# Altium project PGS-System.PrjPcb (part 5 of 16)

## Sheet BUCK_CONTROLLER_SHEET2.SchDoc
size A4; SheetNumber: 4; SheetTotal: 28
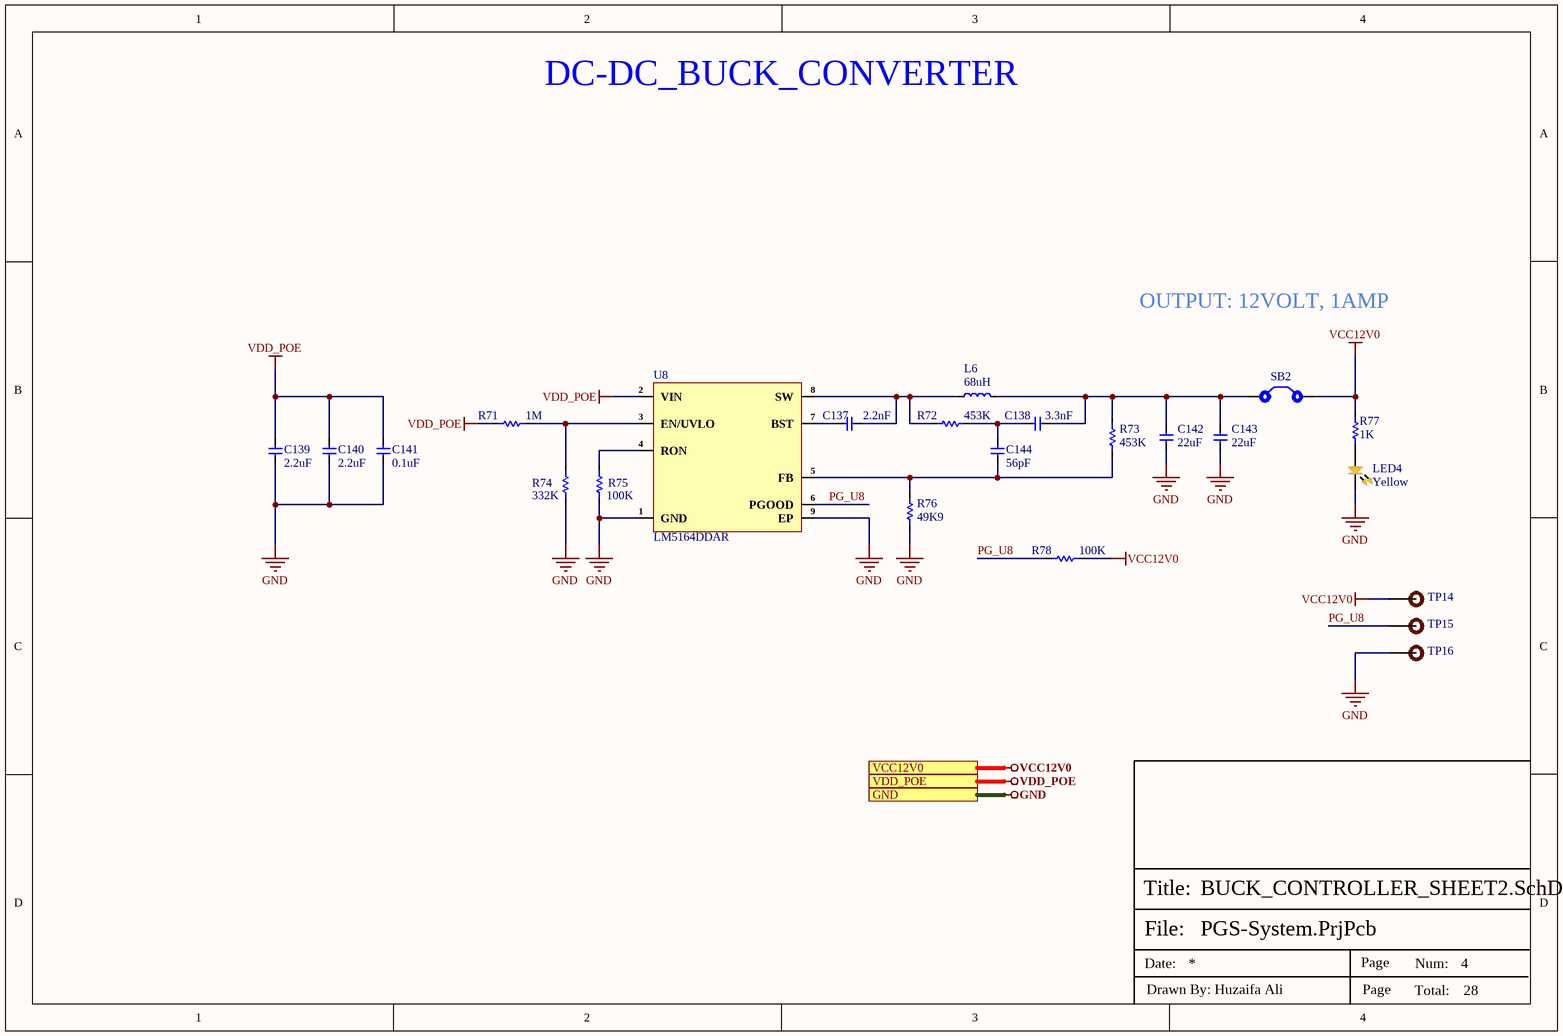
[diagram p3: BUCK_CONTROLLER_SHEET2.SchDoc]

### Parts
C137  2.2nF  [Cap-0603]
C138  3.3nF  [Cap-0603]
C139  2.2uF  [Cap-0805]
C140  2.2uF  [Cap-0805]
C141  0.1uF  [Cap-0603]
C142  22uF  [Cap-0805]
C143  22uF  [Cap-0805]
C144  56pF  [Cap-0402]
L6  68uH  [PSPMAA0605H-680M-IGF]
LED4  Yellow  [LED-0402]
R71  1M  [Res-0603]
R72  453K  [Res-0603]
R73  453K  [Res-0603]
R74  332K  [Res-0603]
R75  100K  [Res-0603]
R76  49K9  [Res-0603]
R77  1K  [Res-0402]
R78  100K  [Res-0603]
SB2  Solder Bridge_1206  [SOLDER BRIDGE-1206_]  (value not drawn)  (no BOM)
TP14  TEST POINT 0.5mm Dia  [Test-point - 0.5mm]  (value not drawn)  (no BOM)
TP15  TEST POINT 0.5mm Dia  [Test-point - 0.5mm]  (value not drawn)  (no BOM)
TP16  TEST POINT 0.5mm Dia  [Test-point - 0.5mm]  (value not drawn)  (no BOM)
U8  LM5164DDAR  [8-SO-EP_]

### Ports
GND (see BUCK_CONVERTER_SHEET1[3D], DDR3_SDRAM_SHEET[5D], DEBUG_UART_INTERFACE[3D], DIGITAL_MEMS_INTERFACE[3C], eMMC_INTERFACE[3D], ETH_PoE-PD_INTERFACE[4D], ETH_SWITCH_INTERFACE[5D], IR-CUT_LIGHT SENSOR_SHEET[3D], MIPI TO HDMI_MODULE[3D], MIPI-CSI_RXX_INTERFACE[3C], PoE_PSE_CONTROLLER[5D], POWER_LDO_SHEET[3D], POWER_PMIC_RK809_CODEC[3C], POWER_PMIC_RK809_DC DC[3D], POWER_PMIC_RK809_LDO[4C], POWER_PMIC_RK809_MGM[3D], RV1126_AUDIO_SHEET[3D], RV1126_DRAM_SHEET[4C], RV1126_eMMC_SPI-FLASH[3C], RV1126_ETHERNET_SHEET[3D], RV1126_OSC-PLL-PMUIO[3C], RV1126_POWER_SHEET[1D], RV1126_SARADC_SHEET[3C], RV1126_SDMMC_SHEET[3C], SPEARKER_INTERFACE_SHEET[3C], SPI_FLASH_INTERFACE[3D], USB2.0_DEBUG_UART[3D]), VCC12V0 (see SPEARKER_INTERFACE_SHEET[3C]), VDD_POE (see BUCK_CONVERTER_SHEET1[3D], ETH_PoE-PD_INTERFACE[4D], PoE_PSE_CONTROLLER[5D])

### Nets
GND: C139.1 C140.1 C141.1 C142.1 C143.1 LED4.2 R74.2 R75.1 R76.1 TP16.1 U8.1(GND) U8.9(EP) ; port GND  [project net KSENSD]
VCC12V0: R77.2 R78.1 SB2.2 TP14.1 ; port VCC12V0
VDD_POE: C139.2 C140.2 C141.2 R71.2 U8.2(VIN) ; port VDD_POE
PG_U8: R78.2 TP15.1 U8.6(PGOOD)
NetC137_1: C137.1 L6.1 R72.1 U8.8(SW)
NetC137_2: C137.2 U8.7(BST)
NetC138_1: C138.1 C144.2 R72.2
NetC138_2: C138.2 C142.2 C143.2 L6.2 R73.2 SB2.1
NetC144_1: C144.1 R73.1 R76.2 U8.5(FB)
NetLED4_1: LED4.1 R77.1
NetR71_1: R71.1 R74.1 U8.3(EN/UVLO)
NetR75_2: R75.2 U8.4(RON)

### Notes on the sheet
- DC-DC_BUCK_CONVERTER
- OUTPUT: 12VOLT, 1AMP
- File:
- Title:
- Date:
- Page
- Num:
- Total:
- Drawn By: Huzaifa Ali

### Library data of the parts
C137 = CC0603KRX7R9BB222: CAP CER 2200PF 50V X7R 0603; Manufacturer: Yageo; Tolerance: 10%; Insulation Resistance: 10GR; Dissipation Factor: 2.5%; Item Type: Capacitor; Supplier 1: RSComponents; Manufacturer Part Number: CC0603KRX7R9BB222; RoHS: Yes; Category: Ceramic Capacitors; Stock 1: 1; Pricing 1: 4000=0.00500 (USD); Mount: Surface Mount; Case/Package: 0603; Number of Pins: 2; Case Code (Metric): 1608; Case Code (Imperial): 0603; Min Operating Temperature: -55°C; Max Operating Temperature: 125°C; Capacitance: 2.2nF; Dielectric: X7R; Package Quantity: 1; Voltage Rating: 50V; Packaging: Tape and Reel; Voltage Rating (DC): 50V; Termination: SMD/SMT; Resistor Type: Ceramic; Voltage: 50V; Series: CC; Length: 1.6mm; Width: 0.031inch; Height: 0.8mm; Thickness: 0.035inch; Depth: 0.8mm; Radiation Hardening: No; REACH SVHC: No SVHC; Lead Free: Lead Free; Halogen Free: Halogen Free; RoHS Compliant: Yes; ComponentLink1URL: https://datasheet.ciiva.com/23768/1079489-23768004.pdf?src-supplier=Newark; ComponentLink1Description: https://datasheet.ciiva.com/23768/1079489-23768004.pdf?src-supplier=Newark; ComponentLink2URL: https://datasheet.ciiva.com/11788/0900766b8079c870-11788403.pdf?src-supplier=RSComponents; ComponentLink2Description: https://datasheet.ciiva.com/11788/0900766b8079c870-11788403.pdf?src-supplier=RSComponents; ComponentLink3URL: https://datasheet.ciiva.com/26862/getdatasheetpartid-403587-26862854.pdf?src-supplier=Verical; ComponentLink3Description: https://datasheet.ciiva.com/26862/getdatasheetpartid-403587-26862854.pdf?src-supplier=Verical; ComponentLink4URL: https://datasheet.ciiva.com/8033/70765-8033863.pdf?src-supplier=Element14; ComponentLink4Description: https://datasheet.ciiva.com/8033/70765-8033863.pdf?src-supplier=Element14; ComponentLink5URL: https://datasheet.ciiva.com/7978/1489800-7978172.pdf?src-supplier=Element14; ComponentLink5Description: https://datasheet.ciiva.com/7978/1489800-7978172.pdf?src-supplier=Element14; ComponentLink6URL: https://datasheet.ciiva.com/28450/1489800-28450632.pdf?src-supplier=Element14; ComponentLink6Description: https://datasheet.ciiva.com/28450/1489800-28450632.pdf?src-supplier=Element14; ComponentLink7URL: https://datasheet.ciiva.com/155/mlccorderingcode-155921.pdf?src-supplier=Digi-Key; ComponentLink7Description: https://datasheet.ciiva.com/155/mlccorderingcode-155921.pdf?src-supplier=Digi-Key; ComponentLink8URL: https://datasheet.ciiva.com/155/mlccorderingcode-155920.pdf?src-supplier=Digi-Key; ComponentLink8Description: https://datasheet.ciiva.com/155/mlccorderingcode-155920.pdf?src-supplier=Digi-Key; ComponentLink9URL: https://datasheet.ciiva.com/155/mlccorderingcode-155922.pdf?src-supplier=Digi-Key; ComponentLink9Description: https://datasheet.ciiva.com/155/mlccorderingcode-155922.pdf?src-supplier=Digi-Key; ComponentLink10URL: https://datasheet.ciiva.com/8033/1489800-8033864.pdf?src-supplier=Element14; ComponentLink10Description: https://datasheet.ciiva.com/8033/1489800-8033864.pdf?src-supplier=Element14; ComponentLink11URL: https://datasheet.ciiva.com/8033/1489800-8033862.pdf?src-supplier=Element14; ComponentLink11Description: https://datasheet.ciiva.com/8033/1489800-8033862.pdf?src-supplier=Element14; ComponentLink12URL: https://datasheet.ciiva.com/16625/upy-gphc-x7r-6-3v-to-50v-8-16625531.pdf?src-supplier=Avnet+Europe; ComponentLink12Description: https://datasheet.ciiva.com/16625/upy-gphc-x7r-6-3v-to-50v-8-16625531.pdf?src-supplier=Avnet+Europe; Supplier Part Number 1: 6169509; LCSC Part Number: C107082
C138 = 0603B332K500CT: MLCC 3.3nF 50V X7R 0603; Manufacturer: Walsin Technologies; Tolerance: 10%; Item Type: Capacitor; Supplier 1: Arrow Electronics; Manufacturer Part Number: 0603B332K500CT; RoHS: Yes; Category: Ceramic Capacitors; Stock 1: 88000; Pricing 1: 4000=0.00570, 12000=0.00560 (USD); Case/Package: Ceramic; Case Code (Metric): 1608; Case Code (Imperial): 0603; Min Operating Temperature: -55°C; Max Operating Temperature: 125°C; Packaging: Tape and Reel; Capacitance: 3.3nF; Dielectric: X7R; Voltage Rating: 50V; Voltage Rating (DC): 50V; Length: 1.6mm; Depth: 0.8mm; Radiation Hardening: No; RoHS Compliant: Yes; REACH SVHC: Unknown; Lead Free: Lead Free; ComponentLink1URL: https://datasheet.ciiva.com/26864/getdatasheetpartid-414329-26864536.pdf?src-supplier=Verical; ComponentLink1Description: https://datasheet.ciiva.com/26864/getdatasheetpartid-414329-26864536.pdf?src-supplier=Verical; Supplier Part Number 1: 0603B332K500CT; LCSC Part Number: C302028
C139 C140 = GRM21BD72A225KE01L: as C249 on sheet BUCK_CONVERTER_SHEET1; Supplier 1: Digi-Key; Manufacturer Part Number: GRM21BD72A225KE01L; RoHS: No; Category: Ceramic Capacitors; Stock 1: 2439; Pricing 1: 1=0.55000, 10=0.38600, 50=0.29220, 100=0.25440, 500=0.18846, 1000=0.16020 (USD); RoHS Compliant: Yes; LCSC Part Number: C2981733; ComponentLink1Description: LCSC; ComponentLink1URL: https://www.lcsc.com/product-detail/Multilayer-Ceramic-Capacitors-MLCC-SMD-SMT_Murata-Electronics-GRM21BD72A225KE01L_C2981733.html; Supplier Part Number 1: 490-GRM21BD72A225KE01LCT-ND
C141 = CC0603KRX7R0BB104: as C119 on sheet ETH_PoE-PD_INTERFACE; Supplier 1: Digi-Key; Manufacturer Part Number: CC0603KRX7R0BB104; RoHS: Yes; Category: Ceramic Capacitors; Stock 1: 60476; Pricing 1: 1=0.19000, 10=0.13500, 50=0.07680, 100=0.06370, 500=0.04466, 1000=0.03696 (USD); Mount: Surface Mount; Case/Package: 0603; Case Code (Metric): 1608; Case Code (Imperial): 0603; Weight: 7.1E-05oz; Min Operating Temperature: -55°C; Max Operating Temperature: 125°C; Package Quantity: 4000; Voltage Rating: 100V; Packaging: Tape and Reel; Dielectric: X7R; Termination: SMD/SMT; Resistor Type: Ceramic; Voltage Rating (DC): 100V; Series: CC; Length: 0.063inch; Width: 0.031inch; Thickness: 0.035inch; Depth: 0.8mm; Lead Free: Lead Free; RoHS Compliant: Yes; ComponentLink1URL: https://datasheet.ciiva.com/6277/mlccorderingcode-6277030.pdf?src-supplier=Digi-Key; ComponentLink1Description: https://datasheet.ciiva.com/6277/mlccorderingcode-6277030.pdf?src-supplier=Digi-Key; ComponentLink2URL: https://datasheet.ciiva.com/6277/mlccorderingcode-6277081.pdf?src-supplier=Digi-Key; ComponentLink2Description: https://datasheet.ciiva.com/6277/mlccorderingcode-6277081.pdf?src-supplier=Digi-Key; ComponentLink3URL: https://datasheet.ciiva.com/6277/mlccorderingcode-6277082.pdf?src-supplier=Digi-Key; ComponentLink3Description: https://datasheet.ciiva.com/6277/mlccorderingcode-6277082.pdf?src-supplier=Digi-Key; Supplier Part Number 1: 311-1523-1-ND; LCSC Part Number: C113803
C142 C143 = C2012X5R1V226MT000E: CAP CER 22UF 35V X5R 0805; Manufacturer: TDK Corporation; Item Type: Capacitor; Manufacturer Part Number: C2012X5R1V226MT000E; Package: 0805; ComponentLink1Description: LCSC; ComponentLink1URL: https://www.lcsc.com/product-detail/Multilayer-Ceramic-Capacitors-MLCC-SMD-SMT_TDK-C2012X5R1V226M125AC_C2179409.html; LCSC Part Number: C338080
C144 = CC0402FRNPO9BN560: CAP CER 56PF 50V C0G/NPO 0402; Manufacturer: Yageo; Item Type: Capacitor; Supplier: Digikey; Supplier Part Number: 311-3734-1-ND; Manufacturer Part Number: CC0402FRNPO9BN560; RoHS: Yes; Category: Ceramic Capacitors; Stock: 144734; Pricing: 1=0.1, 10=0.067, 50=0.0384, 100=0.0297, 500=0.02238, 1000=0.01758, 2500=0.01598, 5000=0.0147 (USD); ComponentLink1URL: https://datasheet.ciiva.com/11587/upy-gp-np0-16v-to-50v-8-11587063.pdf?src-supplier=Avnet; ComponentLink1Description: https://datasheet.ciiva.com/11587/upy-gp-np0-16v-to-50v-8-11587063.pdf?src-supplier=Avnet; ComponentLink2URL: https://datasheet.ciiva.com/13211/upy-gp-np0-16v-to-50v-8-13211096.pdf?src-supplier=Mouser; ComponentLink2Description: https://datasheet.ciiva.com/13211/upy-gp-np0-16v-to-50v-8-13211096.pdf?src-supplier=Mouser; LCSC Part Number: C526981
L6 = PSPMAA0605H-680M-IGF: 2A 68uH ±20% 2.5A SMD,6.6x7.1mm Power Inductors ROHS; Manufacturer: PROD Tech; Manufacturer Part Number: PSPMAA0605H-680M-IGF; Package: SMD,6.6x7.1mm; LCSC Part Number: C2983094; Item Type: Inductor; ComponentLink1Description: LCSC; ComponentLink1URL: https://www.lcsc.com/product-detail/Power-Inductors_PROD-Tech-PSPMAA0605H-680M-IGF_C2983094.html
LED4 = XZMYK68W-2: LED YELLOW CLEAR CHIP SMD; Manufacturer: SunLED; Lens Color: Colorless; Luminous Intensity: 148mcd; Test Current: 20mA; Viewing Angle: 120°; Dominant Wavelength: 590nm; Forward Voltage: 2V; Supplier 1: Digi-Key; Manufacturer Part Number: XZMYK68W-2; RoHS: Yes; Category: LEDs; Stock 1: 36021; Pricing 1: 1=0.36000, 10=0.28400, 100=0.12770, 500=0.11536, 1000=0.09476 (USD); Mount: Surface Mount; Case/Package: 0402; Color: Yellow; Case Code (Metric): 1005; Case Code (Imperial): 0402; Packaging: Tape and Reel; Lens Transparency: Clear; Length: 1mm; Width: 0.5mm; Height: 0.6mm; RoHS Compliant: Yes; ComponentLink1URL: http://www.sunledusa.com/products/spec/XZMYK68W-2.pdf?src-supplier=Digi-Key; ComponentLink1Description: http://www.sunledusa.com/products/spec/XZMYK68W-2.pdf?src-supplier=Digi-Key; Supplier Part Number 1: 1497-1198-1-ND; Item Type: LED
R71 = RC0603FR-071ML: as R172 on sheet BUCK_CONVERTER_SHEET1; Supplier 1: Digi-Key; Manufacturer Part Number: RC0603FR-071ML; Stock 1: 3824601; Pricing 1: 1=0.1, 10=0.023, 100=0.0094, 1000=0.00421, 2500=0.00366 (USD); Case/Package: 0603; Number of Pins: 2; Case Code (Imperial): 0603; Case Code (Metric): 1608; Min Operating Temperature: -55°C; Max Operating Temperature: 155°C; Voltage Rating (DC): 50V; Tolerance: 1%; Packaging: Tape and Reel; Package Quantity: 5000; Termination: SMD/SMT; Composition: Thick Film; Military Standard: Not; Length: 1.6mm; Height: 0.45mm; Width: 0.8mm; Depth: 0.8mm; REACH SVHC: No SVHC; Lead Free: Lead Free; ComponentLink1URL: http://www.farnell.com/datasheets/2167052.pdf?src-supplier=Mouser; ComponentLink1Description: http://www.farnell.com/datasheets/2167052.pdf?src-supplier=Mouser; ComponentLink2URL: http://www.farnell.com/datasheets/2167052.pdf?src-supplier=Element14; ComponentLink2Description: http://www.farnell.com/datasheets/2167052.pdf?src-supplier=Element14; ComponentLink3URL: http://documents.rs-components.com/techlib://itc_doclist_GB.htm?stockno=5048956&src-supplier=RSComponents; ComponentLink3Description: http://documents.rs-components.com/techlib://itc_doclist_GB.htm?stockno=5048956&src-supplier=RSComponents; Supplier Part Number 1: 311-1.00MHRDKR-ND; LCSC Part Number: C105578
R72 R73 = RC0603FR-07453KL: RES 453K OHM 1% 1/10W 0603; Manufacturer: Yageo; Item Type: Resistor; Supplier: Future Electronics; LCSC Part Number: C273765; Manufacturer Part Number: RC0603FR-07453KL; RoHS: Yes; Stock: 90000; Pricing: 5000=0.0012, 50000=0.0012, 150000=0.0011, 375000=0.0011, 1000000=0.001 (USD); ComponentLink1URL: https://datasheet.ciiva.com/8885/pyu-rc0603-51-rohs-l-4-8885677.pdf?src-supplier=Avnet; ComponentLink1Description: https://datasheet.ciiva.com/8885/pyu-rc0603-51-rohs-l-4-8885677.pdf?src-supplier=Avnet
R74 = RT0603BRD07332KL: RES SMD 332K OHM 0.1% 1/10W 0603; Manufacturer: Yageo; Value: 332kR; Power Rating: 100mW; Voltage Rating: 75V; Temperature Coefficient: 25ppm/°C; Voltage Rating (DC): 50V; Item Type: Resistor; Supplier 1: Rs; Manufacturer Part Number: RT0603BRD07332KL; RoHS: Yes; Category: Chip SMD Resistors; Stock 1: 3940; Pricing 1: 10=0.21700, 100=0.20200, 250=0.18900, 500=0.17600, 1000=0.16000 (GBP); Case/Package: 0603; Case Code (Metric): 1608; Case Code (Imperial): 0603; Weight: 7.1E-05oz; Contact Plating: Tin,Matte; Min Operating Temperature: -55°C; Max Operating Temperature: 125°C; Package Quantity: 5000; Packaging: Tape and Reel; Tolerance: 0.1%; Resistor Type: Thin Film; Number of Terminations: 2; Termination: SMD/SMT; Max Power Dissipation: 100mW; Series: RT; Construction: Rectangular; Length: 1.6mm; Width: 0.031inch; Height: 0.022inch; Depth: 0.8mm; Radiation Hardening: No; Military Standard: Not; Lead Free: Lead Free; RoHS Compliant: Yes; ComponentLink1URL: https://datasheet.ciiva.com/2585/pyu-rt-1-to-0-05-rohs-l-5-2585888.pdf?src-supplier=Digi-Key; ComponentLink1Description: https://datasheet.ciiva.com/2585/pyu-rt-1-to-0-05-rohs-l-5-2585888.pdf?src-supplier=Digi-Key; ComponentLink2URL: https://datasheet.ciiva.com/8886/pyu-rt-1-to-0-05-rohs-l-4-8886136.pdf?src-supplier=Avnet; ComponentLink2Description: https://datasheet.ciiva.com/8886/pyu-rt-1-to-0-05-rohs-l-4-8886136.pdf?src-supplier=Avnet; ComponentLink3URL: https://datasheet.ciiva.com/12811/pyu-rt-1-to-0-05-rohs-l-4-12811625.pdf?src-supplier=Mouser; ComponentLink3Description: https://datasheet.ciiva.com/12811/pyu-rt-1-to-0-05-rohs-l-4-12811625.pdf?src-supplier=Mouser; Supplier Part Number 1: 1991511; LCSC Part Number: C861329
R75 R78 = CRCW0603100KFKEA: RES SMD 100K OHM 1% 1/10W 0603; Item Type: Resistor; Value: 100kR; Temperature Coefficient: 100ppm/°C; Voltage Rating: 75V; Power Rating: 100mW; ComponentLink1Description: LCSC; Supplier: Mouser; Supplier Part Number: 71-CRCW0603-100K-E3; RoHS: Yes; Category: Chip SMD Resistors; Stock: 716604; Pricing: 1=0.1, 10=0.019, 50=0.019, 100=0.009, 1000=0.007, 10000=0.004 (USD); Case/Package: 345Case; Pins: 2NUMBER; Case Code (Imperial): 0603; Case Code (Metric): 1608; Min Operating Temperature: -55°C; Max Operating Temperature: 155°C; Tolerance: 1%; Resistor Type: Thick Film; Resistance Tolerance: 1%; Packaging: 13Packaging; Voltage Rating (DC): 75V; Features: 6309FeaturesType; Height: 500um; RoHS Compliant: Yes; Lead Free: 5697LeadFree; ComponentLink2URL: http://www.farnell.com/datasheets/2310790.pdf?src-supplier=Farnell; ComponentLink2Description: http://www.farnell.com/datasheets/2310790.pdf?src-supplier=Farnell; ComponentLink3URL: https://datasheet.octopart.com/CRCW0603100KFKEA-Vishay-datasheet-14722531.pdf?src-supplier=Newark; ComponentLink3Description: https://datasheet.octopart.com/CRCW0603100KFKEA-Vishay-datasheet-14722531.pdf?src-supplier=Newark; ComponentLink4URL: https://www.vishay.com/docs/20035/dcrcwe3.pdf?src-supplier=Digi-Key; ComponentLink4Description: https://www.vishay.com/docs/20035/dcrcwe3.pdf?src-supplier=Digi-Key; ComponentLink5URL: https://datasheet.octopart.com/CRCW0603100KFKEA-Vishay-datasheet-5300368.pdf?src-supplier=Future+Electronics; ComponentLink5Description: https://datasheet.octopart.com/CRCW0603100KFKEA-Vishay-datasheet-5300368.pdf?src-supplier=Future+Electronics; ComponentLink6URL: http://www.farnell.com/datasheets/2310790.pdf?src-supplier=Newark; ComponentLink6Description: http://www.farnell.com/datasheets/2310790.pdf?src-supplier=Newark; ComponentLink7URL: http://www.farnell.com/datasheets/2310790.pdf?src-supplier=Element14; ComponentLink7Description: http://www.farnell.com/datasheets/2310790.pdf?src-supplier=Element14; ComponentLink8URL: https://datasheet.octopart.com/CRCW0603100KFKEA-Vishay-datasheet-83961561.pdf?src-supplier=Element14; ComponentLink8Description: https://datasheet.octopart.com/CRCW0603100KFKEA-Vishay-datasheet-83961561.pdf?src-supplier=Element14; ComponentLink9URL: https://datasheet.octopart.com/CRCW0603100KFKEA-Vishay-datasheet-8363642.pdf?src-supplier=Verical; ComponentLink9Description: https://datasheet.octopart.com/CRCW0603100KFKEA-Vishay-datasheet-8363642.pdf?src-supplier=Verical; ComponentLink10URL: https://datasheet.octopart.com/CRCW0603100KFKEA-Vishay-datasheet-508714.pdf?src-supplier=Farnell; ComponentLink10Description: https://datasheet.octopart.com/CRCW0603100KFKEA-Vishay-datasheet-508714.pdf?src-supplier=Farnell; ComponentLink11URL: https://datasheet.octopart.com/CRCW0603100KFKEA-Vishay-datasheet-17834126.pdf?src-supplier=TME; ComponentLink11Description: https://datasheet.octopart.com/CRCW0603100KFKEA-Vishay-datasheet-17834126.pdf?src-supplier=TME; LCSC Part Number: C844916
R76 = RC0603FR-0749K9L: as R163 on sheet ETH_PoE-PD_INTERFACE; Supplier 1: Digi-Key; Manufacturer Part Number: RC0603FR-0749K9L; RoHS: Yes; Category: Chip SMD Resistors; Stock 1: 77863; Pricing 1: 1=0.10000, 10=0.02400, 100=0.00970, 1000=0.00436, 2500=0.00378 (USD); Mount: Surface Mount; Case/Package: 0603; Case Code (Metric): 1608; Case Code (Imperial): 0603; Size Code: 0603; Min Operating Temperature: -55°C; Max Operating Temperature: 155°C; Tolerance: 1%; Packaging: Tape and Reel; Package Quantity: 1; Voltage Rating: 50V; Resistor Type: Thick Film; Number of Terminations: 2; Termination: SMD/SMT; Max Power Dissipation: 100mW; Features: Moisture Resistant; Series: RC; Construction: Rectangular; Length: 0.063inch; Width: 0.031inch; Height: 0.022inch; Depth: 0.8mm; Lead Free: Lead Free; Military Standard: Not; RoHS Compliant: Yes; ComponentLink1URL: https://datasheet.ciiva.com/2454/pyu-r-int-thick-7-2454042.pdf?src-supplier=Digi-Key; ComponentLink1Description: https://datasheet.ciiva.com/2454/pyu-r-int-thick-7-2454042.pdf?src-supplier=Digi-Key; ComponentLink2URL: https://datasheet.ciiva.com/2454/pyu-r-int-thick-7-2454043.pdf?src-supplier=Digi-Key; ComponentLink2Description: https://datasheet.ciiva.com/2454/pyu-r-int-thick-7-2454043.pdf?src-supplier=Digi-Key; ComponentLink3URL: https://datasheet.ciiva.com/2454/pyu-r-int-thick-7-2454044.pdf?src-supplier=Digi-Key; ComponentLink3Description: https://datasheet.ciiva.com/2454/pyu-r-int-thick-7-2454044.pdf?src-supplier=Digi-Key; ComponentLink4URL: https://datasheet.ciiva.com/15189/getdatasheetpartid-323805-15189749.pdf?src-supplier=Verical; ComponentLink4Description: https://datasheet.ciiva.com/15189/getdatasheetpartid-323805-15189749.pdf?src-supplier=Verical; Supplier Part Number 1: 311-49.9KHRCT-ND; LCSC Part Number: C114624
R77 = CRCW04021K00FKEDHP: as R182 on sheet BUCK_CONVERTER_SHEET1; Supplier 1: Digi-Key; Manufacturer Part Number: CRCW04021K00FKEDHP; Stock 1: 315989; Pricing 1: 1=0.15, 10=0.132, 100=0.0506, 1000=0.02226, 2500=0.01923, 5000=0.0172 (USD); Mount: Surface Mount; Case/Package: 0402; Number of Pins: 2; Contact Plating: Tin; Weight: 2.3E-05oz; Case Code (Imperial): 0402; Case Code (Metric): 1005; Size Code: 0402; Min Operating Temperature: -55°C; Max Operating Temperature: 155°C; Tolerance: 1%; Resistor Type: Thick Film; Package Quantity: 10; Packaging: Tape and Reel; Number of Terminations: 2; Termination: SMD/SMT; Max Power Dissipation: 125mW; Voltage Rating (DC): 50V; Features: Automotive AEC-Q200; Series: CRCW-HP; Construction: Rectangular; Technology: THICK FILM; Resistance Tolerance: 1%; Length: 1mm; Width: 0.5mm; Height: 0.3mm; Depth: 0.5mm; Radiation Hardening: No; REACH SVHC: Unknown; Military Standard: Not; Lead Free: Lead Free; RoHS Compliant: Yes; ComponentLink1URL: http://www.farnell.com/datasheets/2339608.pdf?src-supplier=Element14; ComponentLink1Description: http://www.farnell.com/datasheets/2339608.pdf?src-supplier=Element14; ComponentLink2URL: http://www.vishay.com/docs/20043/crcwhpe3.pdf?src-supplier=Digi-Key; ComponentLink2Description: http://www.vishay.com/docs/20043/crcwhpe3.pdf?src-supplier=Digi-Key; ComponentLink3URL: http://www.mouser.com/ds/2/427/crcwhpe3-46056.pdf?src-supplier=Mouser; ComponentLink3Description: http://www.mouser.com/ds/2/427/crcwhpe3-46056.pdf?src-supplier=Mouser; ComponentLink4URL: http://www.vishay.com/docs/20043/crcwhpe3.pdf?src-supplier=Avnet; ComponentLink4Description: http://www.vishay.com/docs/20043/crcwhpe3.pdf?src-supplier=Avnet; ComponentLink5URL: http://www.vishay.com/docs/20043/crcwhpe3.pdf?src-supplier=Future+Electronics; ComponentLink5Description: http://www.vishay.com/docs/20043/crcwhpe3.pdf?src-supplier=Future+Electronics; Supplier Part Number 1: 541-1.00KYCT-ND; LCSC Part Number: C313354
SB2 = Solder Bridge_1206: Solder Bridge ON; Manufacturer Part Number: Solder Bridge_1206; Item Type: Solder Bridge
TP14-TP16 = TEST POINT 0.5mm Dia: Test Point ON; Item Type: Test Point; Manufacturer Part Number: TEST POINT 0.5mm Dia
U8 = LM5164DDAR: IC REG BUCK ADJ 1A 8SOPWR; Manufacturer: Texas Instruments; Max Duty Cycle: 99%; Max Supply Voltage: 100V; Min Supply Voltage: 6V; Nominal Supply Current: 600uA; Number of Channels: 1NUMBER; Switching Frequency: 1MHz; Supplier: Mouser; LCSC Part Number: C477928; Manufacturer Part Number: LM5164DDAR; RoHS: Yes; Item Type: IC; Stock: 1957; Pricing: 1=3.78, 10=3.22, 50=3.22, 100=2.79, 1000=2, 10000=1.88 (USD); Pins: 8NUMBER; Min Operating Temperature: -40°C; Max Operating Temperature: 150°C; Number of Outputs: 1NUMBER; Output Current: 1A; Length: 4.89mm; Width: 3.9mm; Height: 1.7mm; Thickness: 1.48mm

## Sheet POWER_LDO_SHEET.SchDoc
size A4; SheetNumber: 4; SheetTotal: 25
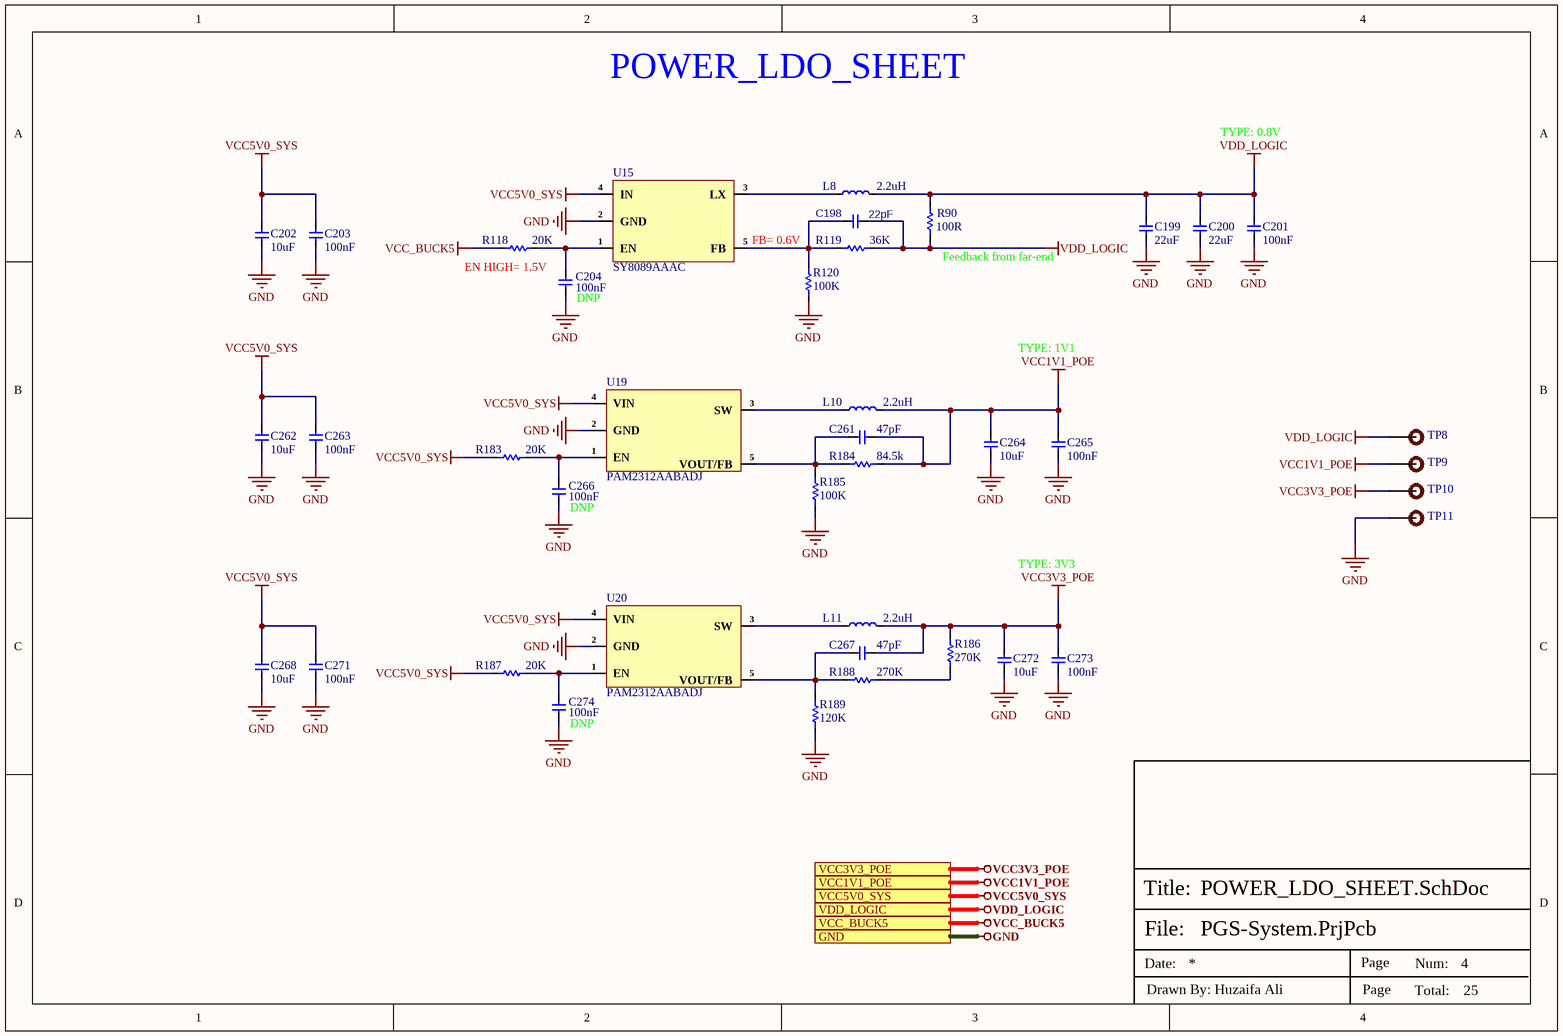
[diagram p4: POWER_LDO_SHEET.SchDoc]

### Parts
C198  22pF  [Cap-0402]
C199  22uF  [Cap-0603]
C200  22uF  [Cap-0603]
C201  100nF  [CAP-0201]
C202  10uF  [Cap-0603]
C203  100nF  [CAP-0201]
C204  DNP  [CAP-0201]
C261  47pF  [Cap-0402]
C262  10uF  [Cap-0603]
C263  100nF  [CAP-0201]
C264  10uF  [Cap-0603]
C265  100nF  [CAP-0201]
C266  DNP  [CAP-0201]
C267  47pF  [Cap-0402]
C268  10uF  [Cap-0603]
C271  100nF  [CAP-0201]
C272  10uF  [Cap-0603]
C273  100nF  [CAP-0201]
C274  DNP  [CAP-0201]
L8  2.2uH  [MHP0302-2R2M_]
L10  2.2uH  [MHP0302-2R2M_]
L11  2.2uH  [MHP0302-2R2M_]
R90  100R  [Res-0402]
R118  20K  [Res-0402]
R119  36K  [Res-0402]
R120  100K  [Res-0402]
R183  20K  [Res-0402]
R184  84.5k  [Res-0402]
R185  100K  [Res-0402]
R186  270K  [Res-0603]
R187  20K  [Res-0402]
R188  270K  [Res-0603]
R189  120K  [Res-0603]
TP8  TEST POINT 0.5mm Dia  [Test-point - 0.5mm]  (value not drawn)  (no BOM)
TP9  TEST POINT 0.5mm Dia  [Test-point - 0.5mm]  (value not drawn)  (no BOM)
TP10  TEST POINT 0.5mm Dia  [Test-point - 0.5mm]  (value not drawn)  (no BOM)
TP11  TEST POINT 0.5mm Dia  [Test-point - 0.5mm]  (value not drawn)  (no BOM)
U15  SY8089AAAC  [SOT-23-5]
U19  PAM2312AABADJ  [SOT-23-5]
U20  PAM2312AABADJ  [SOT-23-5]

### Ports
GND (see DDR3_SDRAM_INTERFACE[4D], DIGITAL_MEMS_MIC_INTERFACE[3D], eMMC_INTERFACE[3D], ETHERNET_SWITCH_INTERFACE[5C], IR-CUT_LIGHT SENSOR_SHEET[3D], MIPI TO HDMI_MODULE_INTERFACE[3D], MIPI-CSI_RXX_INTERFACE[4C], PoE PD INTERFACE[3D], PoE_PSE_CONTROLLER[5D], POWER_PMIC_RK809_CODEC[3D], POWER_PMIC_RK809_DC DC[3D], POWER_PMIC_RK809_LDO[4C], POWER_PMIC_RK809_MANAGEMENT[3D], RV1126_AUDIO_SHEET[3D], RV1126_DRAM_SHEET[4C], RV1126_eMMC_SPI-FLASH_SHEET[3D], RV1126_ETHERNET_SHEET[3D], RV1126_OSC-PLL-PMUIO[3C], RV1126_POWER_SHEET[1D], RV1126_SARADC_SHEET[3C], SPI_FLASH_INTERFACE[3D], SYNCHRONOUS _BUCK_CONTROLLER[3D], USB2.0_DEBUG_UART[3D], WIFI_AP6256_SHEET[4D]), VCC1V1_POE (see ETHERNET_SWITCH_INTERFACE[5C]), VCC3V3_POE (see ETHERNET_SWITCH_INTERFACE[5C], PoE_PSE_CONTROLLER[5D]), VCC5V0_SYS (see IR-CUT_LIGHT SENSOR_SHEET[3D], MIPI TO HDMI_MODULE_INTERFACE[3D], POWER_PMIC_RK809_CODEC[3D], POWER_PMIC_RK809_DC DC[3D], POWER_PMIC_RK809_LDO[4C], POWER_PMIC_RK809_MANAGEMENT[3D], RV1126_OSC-PLL-PMUIO[3C], SYNCHRONOUS _BUCK_CONTROLLER[3D], USB2.0_DEBUG_UART[3D]), VCC_BUCK5 (see POWER_PMIC_RK809_LDO[4C]), VDD_LOGIC (see RV1126_POWER_SHEET[1D])

### Nets
GND: C199.1 C200.1 C201.1 C202.1 C203.1 C204.1 C262.1 C263.1 C264.1 C265.1 C266.1 C268.1 C271.1 C272.1 C273.1 C274.1 R120.1 R185.2 R189.1 TP11.1 U15.2(GND) U19.2(GND) U20.2(GND) ; port GND  [project net KSENSD]
VCC1V1_POE: C261.2 C264.2 C265.2 L10.2 R184.2 TP9.1 ; port VCC1V1_POE
VCC3V3_POE: C267.2 C272.2 C273.2 L11.2 R186.2 TP10.1 ; port VCC3V3_POE
VCC5V0_SYS: C202.2 C203.2 C262.2 C263.2 C268.2 C271.2 R183.1 R187.1 U15.4(IN) U19.4(VIN) U20.4(VIN) ; port VCC5V0_SYS
VCC_BUCK5: R118.1 ; port VCC_BUCK5
VDD_LOGIC: C198.2 C199.2 C200.2 C201.2 L8.2 R90.1 R90.2 R119.2 TP8.1 ; port VDD_LOGIC
NetC198_1: C198.1 R119.1 R120.2 U15.5(FB)
NetC204_2: C204.2 R118.2 U15.1(EN)
NetC261_1: C261.1 R184.1 R185.1 U19.5(VOUT/FB)
NetC266_2: C266.2 R183.2 U19.1(EN)
NetC267_1: C267.1 R188.1 R189.2 U20.5(VOUT/FB)
NetC274_2: C274.2 R187.2 U20.1(EN)
NetL8_1: L8.1 U15.3(LX)
NetL10_1: L10.1 U19.3(SW)
NetL11_1: L11.1 U20.3(SW)
NetR186_1: R186.1 R188.2

### Notes on the sheet
- POWER_LDO_SHEET
- TYPE: 0.8V
- FB= 0.6V
- EN HIGH= 1.5V
- (near C204) 100nF
- (near R90) Feedback from far-end
- TYPE: 1V1
- (near C266) 100nF
- TYPE: 3V3
- (near C274) 100nF
- File:
- Title:
- Date:
- Page
- Num:
- Total:
- Drawn By: Huzaifa Ali

### Library data of the parts
C198 = 04025A220FAT2A: CAP CER 22PF 50V C0G/NP0 0402; Manufacturer: Kyocera AVX; Tolerance: 1%; Dielectric: C0G; Item Type: Capacitor; ComponentLink1URL: http://psearch.murata.com/capacitor/product/GCM219R71C105KA37%23.pdf; ComponentLink1Description: http://psearch.murata.com/capacitor/product/GCM219R71C105KA37%23.pdf; ComponentLink2URL: http://search.murata.co.jp/Ceramy/image/img/A01X/partnumbering_e_02.pdf; ComponentLink2Description: http://search.murata.co.jp/Ceramy/image/img/A01X/partnumbering_e_02.pdf; ComponentLink3URL: http://psearch.en.murata.com/capacitor/product/GCM219R71C105KA37%23.pdf; ComponentLink3Description: http://psearch.en.murata.com/capacitor/product/GCM219R71C105KA37%23.pdf; ComponentLink4URL: http://uk.rs-online.com/webdocs/0ef9/0900766b80ef92d0.pdf; ComponentLink4Description: http://uk.rs-online.com/webdocs/0ef9/0900766b80ef92d0.pdf; ComponentLink5URL: http://www.yageo.com/documents/recent/UPY-GP_NP0_16V-to-50V_16.pdf; ComponentLink5Description: http://www.yageo.com/documents/recent/UPY-GP_NP0_16V-to-50V_16.pdf; ComponentLink6URL: http://www.farnell.com/datasheets/1443161.pdf; ComponentLink6Description: http://www.farnell.com/datasheets/1443161.pdf; ComponentLink7URL: http://www.yageo.com/documents/recent/UPY-GP_NP0_16V-to-50V_8.pdf; ComponentLink7Description: http://www.yageo.com/documents/recent/UPY-GP_NP0_16V-to-50V_8.pdf; ComponentLink8URL: http://www.farnell.com/datasheets/1132289.pdf; ComponentLink8Description: http://www.farnell.com/datasheets/1132289.pdf; ComponentLink9URL: http://www.mouser.com/ds/2/447/Yageo_UPY-GP_NP0_16V-to-50V_9-358835.pdf; ComponentLink9Description: http://www.mouser.com/ds/2/447/Yageo_UPY-GP_NP0_16V-to-50V_9-358835.pdf; ComponentLink10URL: https://www.verical.com/server-webapp/html/getDatasheet?partID=370074; ComponentLink10Description: https://www.verical.com/server-webapp/html/getDatasheet?partID=370074; ComponentLink11URL: http://catalogs.avx.com/SurfaceMount.pdf; ComponentLink11Description: http://catalogs.avx.com/SurfaceMount.pdf; ComponentLink12URL: http://www.avxcorp.com/docs/Catalogs/ccog.pdf; ComponentLink12Description: http://www.avxcorp.com/docs/Catalogs/ccog.pdf; ComponentLink13URL: http://www.mouser.com/ds/2/40/C0GNP0-Dielectric-951274.pdf; ComponentLink13Description: http://www.mouser.com/ds/2/40/C0GNP0-Dielectric-951274.pdf; Supplier 1: Digi-Key; Manufacturer Part Number: 04025A220FAT2A; Stock 1: 100000; Pricing 1: 1=0.67, 10=0.472, 100=0.3105, 500=0.23, 1000=0.1955, 2500=0.184, 5000=0.1725 (USD); Mount: Surface Mount; Case/Package: 0402; Case Code (Metric): 1005; Case Code (Imperial): 0402; Contact Plating: Matte,Tin; Min Operating Temperature: -55°C; Max Operating Temperature: 125°C; Capacitance: 22pF; Packaging: Tape and Reel; Voltage Rating (DC): 50V; Voltage Rating: 50V; Package Quantity: 1; Termination: SMD/SMT; Length: 1mm; Height: 0.56mm; Depth: 0.5mm; Width: 0.02inch; Thickness: 0.022inch; Radiation Hardening: No; REACH SVHC: Unknown; Lead Free: Lead Free; Supplier Part Number 1: 478-5765-1-ND; LCSC Part Number: C597022
C199 C200 = CC0603MRX5R5BB226: CAP CER 22UF 6.3V X5R 0603; Manufacturer: Yageo; Tolerance: 20%; Supplier 1: Mouser; Manufacturer Part Number: CC0603MRX5R5BB226; RoHS: Yes; Category: Ceramic Capacitors; Stock 1: 3030; Pricing 1: 1=0.33000, 10=0.22500, 50=0.22500, 100=0.12800, 1000=0.07900, 10000=0.06500 (USD); Mount: Surface Mount; Case/Package: 0603; Case Code (Metric): 1608; Case Code (Imperial): 0603; Weight: 7.1E-05oz; Min Operating Temperature: -55°C; Max Operating Temperature: 85°C; Capacitance: 22uF; Packaging: Tape and Reel; Dielectric: X5R; Voltage Rating: 6.3V; Termination: SMD/SMT; Resistor Type: Ceramic; Voltage Rating (DC): 6.3V; Package Quantity: 4000; Length: 0.063inch; Width: 0.031inch; Thickness: 0.035inch; Depth: 0.8mm; Lead Free: Lead Free; Halogen Free: Halogen Free; RoHS Compliant: Yes; ComponentLink1URL: http://www.mouser.com/ds/2/447/Yageo_UPY-GP_NP0_16V-to-50V_9-358835.pdf?src-supplier=Mouser; ComponentLink1Description: http://www.mouser.com/ds/2/447/Yageo_UPY-GP_NP0_16V-to-50V_9-358835.pdf?src-supplier=Mouser; ComponentLink2URL: http://www.yageo.com/documents/recent/UPY-GPHC_X5R_4V-to-50V_25.pdf?src-supplier=Digi-Key; ComponentLink2Description: http://www.yageo.com/documents/recent/UPY-GPHC_X5R_4V-to-50V_25.pdf?src-supplier=Digi-Key; Supplier Part Number 1: 603-CC603MRX5R5BB226; LCSC Part Number: C109448
C201 C203 C263 C265 C271 C273 = CC0201KRX5R6BB104: as C257 on sheet BUCK_CONVERTER_SHEET1; Supplier 1: Mouser; Manufacturer Part Number: CC0201KRX5R6BB104; RoHS: Yes; Category: Ceramic Capacitors; Stock 1: 824403; Pricing 1: 1=0.10000, 10=0.02400, 50=0.02400, 100=0.01900, 1000=0.01100, 10000=0.00900 (USD); Mount: Surface Mount; Case/Package: 0201; Case Code (Imperial): 0201; Case Code (Metric): 0603; Weight: 6E-06oz; Min Operating Temperature: -55°C; Max Operating Temperature: 85°C; Capacitance: 100nF; Dielectric: X5R; Voltage Rating (DC): 10V; Packaging: Tape and Reel; Termination: SMD/SMT; Resistor Type: Ceramic; Voltage Rating: 10V; Series: CC; Construction: Flat; Length: 0.6mm; Width: 0.012inch; Height: 0.3mm; Thickness: 0.013inch; Depth: 0.3mm; Radiation Hardening: No; Lead Free: Lead Free; Halogen Free: Halogen Free; RoHS Compliant: Yes; ComponentLink1URL: https://datasheet.ciiva.com/11587/upy-gphc-x5r-4v-to-50v-12-11587190.pdf?src-supplier=Avnet; ComponentLink1Description: https://datasheet.ciiva.com/11587/upy-gphc-x5r-4v-to-50v-12-11587190.pdf?src-supplier=Avnet; Supplier Part Number 1: 603-CC201KRX5R6BB104; LCSC Part Number: C190183
C202 C262 C264 C268 C272 = CC0603KRX5R6BB106: CAP CER 10UF 10V X5R 0603; Manufacturer: Yageo; Tolerance: 10%; Item Type: Capacitor; Supplier 1: Digi-Key; Manufacturer Part Number: CC0603KRX5R6BB106; RoHS: Yes; Category: Ceramic Capacitors; Stock 1: 187515; Pricing 1: 1=0.24000, 10=0.16300, 50=0.09780, 100=0.08260, 500=0.05654, 1000=0.05001 (USD); Mount: Surface Mount; Case/Package: 0603; Case Code (Metric): 1608; Case Code (Imperial): 0603; Weight: 7.1E-05oz; Min Operating Temperature: -55°C; Max Operating Temperature: 85°C; Capacitance: 10uF; Packaging: Tape and Reel; Dielectric: X5R; Voltage Rating: 10V; Termination: SMD/SMT; Resistor Type: Ceramic; Voltage Rating (DC): 10V; Package Quantity: 4000; Length: 0.063inch; Width: 0.031inch; Thickness: 0.035inch; Depth: 0.8mm; Lead Free: Lead Free; Halogen Free: Halogen Free; RoHS Compliant: Yes; ComponentLink1URL: http://www.mouser.com/ds/2/447/Yageo_UPY-GP_NP0_16V-to-50V_9-358835.pdf?src-supplier=Mouser; ComponentLink1Description: http://www.mouser.com/ds/2/447/Yageo_UPY-GP_NP0_16V-to-50V_9-358835.pdf?src-supplier=Mouser; ComponentLink2URL: http://www.yageo.com/documents/recent/UPY-GPHC_X5R_4V-to-50V_25.pdf?src-supplier=Digi-Key; ComponentLink2Description: http://www.yageo.com/documents/recent/UPY-GPHC_X5R_4V-to-50V_25.pdf?src-supplier=Digi-Key; Supplier Part Number 1: 311-1782-1-ND; LCSC Part Number: C326057
C204 C266 C274 = CC0201KRX5R6BB104: CAP CER 0.1UF 10V X5R 0201; Manufacturer: Yageo; Capacitance: 100nF; Tolerance: 10%; Supplier 1: Mouser; Manufacturer Part Number: CC0201KRX5R6BB104; RoHS: Yes; Category: Ceramic Capacitors; Stock 1: 824403; Pricing 1: 1=0.10000, 10=0.02400, 50=0.02400, 100=0.01900, 1000=0.01100, 10000=0.00900 (USD); Mount: Surface Mount; Case/Package: 0201; Case Code (Imperial): 0201; Case Code (Metric): 0603; Weight: 6E-06oz; Min Operating Temperature: -55°C; Max Operating Temperature: 85°C; Dielectric: X5R; Voltage Rating (DC): 10V; Packaging: Tape and Reel; Termination: SMD/SMT; Resistor Type: Ceramic; Voltage Rating: 10V; Series: CC; Construction: Flat; Length: 0.6mm; Width: 0.012inch; Height: 0.3mm; Thickness: 0.013inch; Depth: 0.3mm; Radiation Hardening: No; Lead Free: Lead Free; Halogen Free: Halogen Free; RoHS Compliant: Yes; ComponentLink1URL: https://datasheet.ciiva.com/11587/upy-gphc-x5r-4v-to-50v-12-11587190.pdf?src-supplier=Avnet; ComponentLink1Description: https://datasheet.ciiva.com/11587/upy-gphc-x5r-4v-to-50v-12-11587190.pdf?src-supplier=Avnet; Supplier Part Number 1: 603-CC201KRX5R6BB104; LCSC Part Number: C190183
C261 C267 = GCM1555C1H470FA16D: CAP CER 47PF 50V C0G/NP0 0402; Manufacturer: Murata; Tolerance: 1%; Supplier 1: Digi-Key; Manufacturer Part Number: GCM1555C1H470FA16D; RoHS: No; Category: Ceramic Capacitors; Stock 1: 27098; Pricing 1: 1=0.11000, 10=0.07900, 50=0.04500, 100=0.03730, 500=0.02618, 1000=0.02168, 2500=0.02018, 5000=0.01846 (USD); Mount: Surface Mount; Case/Package: 0402; Case Code (Imperial): 0402; Case Code (Metric): 1005; Min Operating Temperature: -55°C; Max Operating Temperature: 125°C; Packaging: Tape and Reel; Capacitance: 47pF; Voltage Rating: 50V; Ratings: AEC-Q200; ComponentLink1URL: http://search.murata.co.jp/Ceramy/image/img/A01X/G101/ENG/GCM1555C1H470FA16-01.pdf?src-supplier=Digi-Key; ComponentLink1Description: http://search.murata.co.jp/Ceramy/image/img/A01X/G101/ENG/GCM1555C1H470FA16-01.pdf?src-supplier=Digi-Key; Supplier Part Number 1: 490-16445-1-ND; LCSC Part Number: C393684
L8 L10 L11 = MHP0302-2R2M: 2.8A 2.2uH ±20% 60mΩ 4A SMD,3.4x3x1.8mm Power Inductors ROHS; Manufacturer: Me-TECH; Manufacturer Part Number: MHP0302-2R2M; Footprint: Custom; ComponentLink1Description: LCSC; ComponentLink1URL: https://lcsc.com/product-detail/Power-Inductors_Me-TECH-MHP0302-2R2M_C2934937.html; LCSC Part Number: C2934937
R90 = RC0402FR-07100RL: RES 100 OHM 1% 1/16W 0402; Manufacturer: Yageo; Power Rating: 62.5mW; Voltage Rating: 50V; Temperature Coefficient: 100ppm/°C; Max Power Dissipation: 63mW; Item Type: Resistor; Supplier 1: Mouser; Manufacturer Part Number: RC0402FR-07100RL; RoHS: Yes; Category: Chip SMD Resistors; Stock 1: 699545; Pricing 1: 1=0.10000, 10=0.01200, 50=0.01200, 100=0.00500, 1000=0.00300, 2500=0.00200, 10000=0.00100 (USD); Case/Package: 0402; Number of Pins: 2; Case Code (Imperial): 0402; Case Code (Metric): 1005; Size Code: 0402; Min Operating Temperature: -55°C; Max Operating Temperature: 155°C; Tolerance: 1%; Voltage Rating (DC): 50V; Resistance: 100R; Packaging: Tape and Reel; Termination: SMD/SMT; Resistor Type: Thick Film; Features: Moisture Resistant; Series: RC; Number of Terminations: 2; Resistance Tolerance: 1%; Construction: Rectangular; Technology: THICK FILM; Length: 1mm; Width: 0.5mm; Height: 0.32mm; Depth: 0.5mm; RoHS Compliant: Yes; REACH SVHC: No SVHC; Military Standard: Not; Lead Free: Lead Free; ComponentLink1URL: https://datasheet.ciiva.com/11808/0900766b80c66297-11808765.pdf?src-supplier=RSComponents; ComponentLink1Description: https://datasheet.ciiva.com/11808/0900766b80c66297-11808765.pdf?src-supplier=RSComponents; ComponentLink2URL: https://datasheet.ciiva.com/7849/1784430-7849810.pdf?src-supplier=Element14; ComponentLink2Description: https://datasheet.ciiva.com/7849/1784430-7849810.pdf?src-supplier=Element14; ComponentLink3URL: https://datasheet.ciiva.com/28367/1018594-28367226.pdf?src-supplier=Element14; ComponentLink3Description: https://datasheet.ciiva.com/28367/1018594-28367226.pdf?src-supplier=Element14; ComponentLink4URL: https://datasheet.ciiva.com/22747/1018594-22747511.pdf?src-supplier=Element14; ComponentLink4Description: https://datasheet.ciiva.com/22747/1018594-22747511.pdf?src-supplier=Element14; ComponentLink5URL: https://datasheet.ciiva.com/12667/pyu-rc0402-51-rohs-l-6-r-12667957.pdf?src-supplier=Mouser; ComponentLink5Description: https://datasheet.ciiva.com/12667/pyu-rc0402-51-rohs-l-6-r-12667957.pdf?src-supplier=Mouser; ComponentLink6URL: https://datasheet.ciiva.com/15189/getdatasheetpartid-329466-15189335.pdf?src-supplier=Verical; ComponentLink6Description: https://datasheet.ciiva.com/15189/getdatasheetpartid-329466-15189335.pdf?src-supplier=Verical; ComponentLink7URL: https://datasheet.ciiva.com/16740/pyu-rc0402-51-rohs-l-6-r-16740566.pdf?src-supplier=Future+Electronics; ComponentLink7Description: https://datasheet.ciiva.com/16740/pyu-rc0402-51-rohs-l-6-r-16740566.pdf?src-supplier=Future+Electronics; Supplier Part Number 1: 603-RC0402FR-07100RL; LCSC Part Number: C106232
R118 R183 R187 = RC0402FR-0720KL: RES 20K OHM 1% 1/16W 0402; Manufacturer: Yageo; Resistance: 20kR; Power Rating: 62.5mW; Voltage Rating: 50V; Temperature Coefficient: 100ppm/°C; Max Power Dissipation: 63mW; Item Type: Resistor; Supplier 1: Avnet; Manufacturer Part Number: RC0402FR-0720KL; RoHS: Yes; Category: Chip SMD Resistors; Stock 1: 1960708; Pricing 1: 10000=0.00085 (USD); Case/Package: 0402; Number of Pins: 2; Case Code (Metric): 1005; Case Code (Imperial): 0402; Size Code: 0402; Min Operating Temperature: -55°C; Max Operating Temperature: 155°C; Tolerance: 1%; Package Quantity: 1; Packaging: Tape and Reel; Resistor Type: Thick Film; Number of Terminations: 2; Termination: SMD/SMT; Voltage Rating (DC): 50V; Features: Moisture Resistant; Series: RC; Technology: THICK FILM; Resistance Tolerance: 1%; Construction: Rectangular; Length: 1mm; Width: 0.02inch; Height: 0.016inch; Depth: 0.5mm; RoHS Compliant: Yes; Reach SVHC Compliant: Yes; Military Standard: Not; Lead Free: Lead Free; ComponentLink1URL: https://datasheet.ciiva.com/11808/0900766b80c66297-11808454.pdf?src-supplier=RSComponents; ComponentLink1Description: https://datasheet.ciiva.com/11808/0900766b80c66297-11808454.pdf?src-supplier=RSComponents; ComponentLink2URL: https://datasheet.ciiva.com/7983/1018594-7983511.pdf?src-supplier=Element14; ComponentLink2Description: https://datasheet.ciiva.com/7983/1018594-7983511.pdf?src-supplier=Element14; ComponentLink3URL: https://datasheet.ciiva.com/46394/1018594-46394974.pdf?src-supplier=Element14; ComponentLink3Description: https://datasheet.ciiva.com/46394/1018594-46394974.pdf?src-supplier=Element14; ComponentLink4URL: https://datasheet.ciiva.com/2453/pyu-r-int-thick-7-2453494.pdf?src-supplier=Digi-Key; ComponentLink4Description: https://datasheet.ciiva.com/2453/pyu-r-int-thick-7-2453494.pdf?src-supplier=Digi-Key; ComponentLink5URL: https://datasheet.ciiva.com/2453/pyu-r-int-thick-7-2453495.pdf?src-supplier=Digi-Key; ComponentLink5Description: https://datasheet.ciiva.com/2453/pyu-r-int-thick-7-2453495.pdf?src-supplier=Digi-Key; ComponentLink6URL: https://datasheet.ciiva.com/2453/pyu-r-int-thick-7-2453493.pdf?src-supplier=Digi-Key; ComponentLink6Description: https://datasheet.ciiva.com/2453/pyu-r-int-thick-7-2453493.pdf?src-supplier=Digi-Key; ComponentLink7URL: https://datasheet.ciiva.com/12558/pyu-rc0402-51-rohs-l-6-r-8721-12558796.pdf?src-supplier=Mouser; ComponentLink7Description: https://datasheet.ciiva.com/12558/pyu-rc0402-51-rohs-l-6-r-8721-12558796.pdf?src-supplier=Mouser; Supplier Part Number 1: RC0402FR-0720KL; LCSC Part Number: C93942
R119 = RCS040236K0FKED: RES SMD 36K OHM 1% 1/5W 0402; Manufacturer: Vishay Dale; Resistance: 36kR; Max Power Dissipation: 200mW; Temperature Coefficient: 100ppm/°C; Supplier 1: Digi-Key; Manufacturer Part Number: RCS040236K0FKED; Stock 1: 9900; Pricing 1: 1=0.12, 10=0.105, 100=0.0402, 1000=0.01771, 2500=0.0153, 5000=0.01368 (USD); Case/Package: 0402; Min Operating Temperature: -55°C; Max Operating Temperature: 155°C; Package Quantity: 10000; Packaging: Tape and Reel; Resistor Type: Thick Film; Number of Terminations: 2; Tolerance: 1%; Features: Automotive AEC-Q200; Length: 0.039inch; Width: 0.02inch; Height: 0.016inch; RoHS Compliant: Yes; ComponentLink1URL: http://www.vishay.com/docs/20065/rcse3.pdf?src-supplier=Digi-Key; ComponentLink1Description: http://www.vishay.com/docs/20065/rcse3.pdf?src-supplier=Digi-Key; Supplier Part Number 1: 541-RCS040236K0FKEDCT-ND; LCSC Part Number: C1881070
R120 R185 = RC0402FR-07100KL: RES 100K OHM 1% 1/16W 0402; Manufacturer: Yageo; Resistance: 100kR; Temperature Coefficient: 100ppm/°C; Power Rating: 63mW; Voltage Rating: 50V; Item Type: Resistor; Supplier 1: Mouser; Manufacturer Part Number: RC0402FR-07100KL; RoHS: Yes; Category: Chip SMD Resistors; Stock 1: 7759549; Pricing 1: 1=0.10000, 10=0.01200, 50=0.01200, 100=0.00500, 1000=0.00300, 2500=0.00200, 10000=0.00100 (USD); Case/Package: 0402; Case Code (Metric): 1005; Case Code (Imperial): 0402; Min Operating Temperature: -55°C; Max Operating Temperature: 155°C; Resistor Type: Thick Film; Tolerance: 1%; Packaging: Tape and Reel; Package Quantity: 1; Number of Terminations: 2; Termination: SMD/SMT; Max Power Dissipation: 63mW; Working Voltage: 50V; Features: Moisture Resistant; Series: RC; Resistance Tolerance: 1%; Construction: Rectangular; Technology: THICK FILM; Length: 0.039inch; Width: 0.02inch; Height: 0.016inch; Depth: 0.5mm; REACH SVHC: No SVHC; Lead Free: Lead Free; RoHS Compliant: Yes; Military Standard: Not; ComponentLink1URL: https://datasheet.ciiva.com/11819/0900766b80c66297-11819452.pdf?src-supplier=RSComponents; ComponentLink1Description: https://datasheet.ciiva.com/11819/0900766b80c66297-11819452.pdf?src-supplier=RSComponents; ComponentLink2URL: https://datasheet.ciiva.com/22747/1018594-22747509.pdf?src-supplier=Element14; ComponentLink2Description: https://datasheet.ciiva.com/22747/1018594-22747509.pdf?src-supplier=Element14; ComponentLink3URL: https://datasheet.ciiva.com/2453/pyu-r-int-thick-7-2453362.pdf?src-supplier=Digi-Key; ComponentLink3Description: https://datasheet.ciiva.com/2453/pyu-r-int-thick-7-2453362.pdf?src-supplier=Digi-Key; ComponentLink4URL: https://datasheet.ciiva.com/2453/pyu-r-int-thick-7-2453363.pdf?src-supplier=Digi-Key; ComponentLink4Description: https://datasheet.ciiva.com/2453/pyu-r-int-thick-7-2453363.pdf?src-supplier=Digi-Key; ComponentLink5URL: https://datasheet.ciiva.com/2453/pyu-r-int-thick-7-2453361.pdf?src-supplier=Digi-Key; ComponentLink5Description: https://datasheet.ciiva.com/2453/pyu-r-int-thick-7-2453361.pdf?src-supplier=Digi-Key; ComponentLink6URL: https://datasheet.ciiva.com/12667/pyu-rc0402-51-rohs-l-6-r-12667930.pdf?src-supplier=Mouser; ComponentLink6Description: https://datasheet.ciiva.com/12667/pyu-rc0402-51-rohs-l-6-r-12667930.pdf?src-supplier=Mouser; ComponentLink7URL: https://datasheet.ciiva.com/15189/getdatasheetpartid-323696-15189334.pdf?src-supplier=Verical; ComponentLink7Description: https://datasheet.ciiva.com/15189/getdatasheetpartid-323696-15189334.pdf?src-supplier=Verical; Supplier Part Number 1: 603-RC0402FR-07100KL; LCSC Part Number: C60491
R184 = 0402WGF8452TCE: 62.5mW Thick Film Resistors 50V ±100ppm/℃ ±1% 84.5kΩ 0402 Chip Resistor - Surface Mount ROHS; Manufacturer: UNI-ROYAL(Uniroyal Elec); Value: 84.5kR; Temperature Coefficient: 100ppm/°C; Supplier: LCSC; Supplier Part Number: C26988; Manufacturer Part Number: 0402WGF8452TCE; RoHS: No; Item Type: Resistor; LCSC Part Number: C26988
R186 R188 = RC0603DR-07270KL: RES 270K OHM 0.5% 1/10W 0603; Manufacturer: Yageo; Additional Feature: LASER TRIMMABLE; Power: 100mW; Rated Temperature: 70°C; Value: 270kR; Temperature Coefficient: 100ppm/°C; Working Voltage: 75V; Package Height: 0.45mm; Package Length: 1.6mm; Package Width: 0.8mm; Item Type: Resistor; Supplier 1: Mouser; Manufacturer Part Number: RC0603DR-07270KL; RoHS: Yes; Category: Chip SMD Resistors; Stock 1: 13684; Pricing 1: 1=0.21000, 10=0.07000, 50=0.07000, 100=0.02900, 1000=0.01500, 10000=0.00900 (USD); Mounting Technology: Surface Mount; Pins: 2; Package Shape: Rectangular; Case/Package: 0603; Terminal Finish: Nickel; Min Operating Temperature: -55°C; Max Operating Temperature: 155°C; Tolerance: 0.5%; JESD-609 Code: e3; Resistor Type: FIXED RESISTOR; Construction: Chip; Package Style: SMTMeter; Packaging: Tape and Reel; Technology: METAL GLAZE/THICK FILM; Termination: Wraparound; Reach SVHC Compliant: Yes; RoHS Compliant: Yes; ComponentLink1URL: https://datasheet.ciiva.com:443/pdfs/VipMasterIC/IC/YAGO/YAGO-S-A0008145938/YAGO-S-A0008145938-1.pdf?src-supplier=IHS+Markit; ComponentLink1Description: https://datasheet.ciiva.com:443/pdfs/VipMasterIC/IC/YAGO/YAGO-S-A0008145938/YAGO-S-A0008145938-1.pdf?src-supplier=IHS+Markit; ComponentLink2URL: http://www.yageo.com.tw/exep/pages/download/literatures/PYu-R_INT-thick_7.pdf?src-supplier=Digi-Key; ComponentLink2Description: http://www.yageo.com.tw/exep/pages/download/literatures/PYu-R_INT-thick_7.pdf?src-supplier=Digi-Key; Supplier Part Number 1: 603-RC0603DR-07270KL; LCSC Part Number: C724006
R189 = RT0603BRD07120KL: RES SMD 120K OHM 0.1% 1/10W 0603; Manufacturer: Yageo; Voltage Rating (DC): 75V; Item Type: Resistor; Supplier: Rs; Supplier Part Number: 1991400P; Manufacturer Part Number: RT0603BRD07120KL; RoHS: Yes; Category: Chip SMD Resistors; Stock: 2000; Pricing: 100=0.14, 250=0.117, 500=0.093, 1000=0.077 (GBP); Lead Free: 5697LeadFree; ComponentLink1URL: https://datasheet.ciiva.com/12705/pyu-rt-1-to-0-05-rohs-l-4-12705420.pdf?src-supplier=Mouser; ComponentLink1Description: https://datasheet.ciiva.com/12705/pyu-rt-1-to-0-05-rohs-l-4-12705420.pdf?src-supplier=Mouser; ComponentLink2URL: https://datasheet.ciiva.com/8887/pyu-rt-1-to-0-05-rohs-l-4-8887610.pdf?src-supplier=Avnet; ComponentLink2Description: https://datasheet.ciiva.com/8887/pyu-rt-1-to-0-05-rohs-l-4-8887610.pdf?src-supplier=Avnet; ComponentLink3URL: https://datasheet.ciiva.com/2585/pyu-rt-1-to-0-05-rohs-l-5-2585640.pdf?src-supplier=Digi-Key; ComponentLink3Description: https://datasheet.ciiva.com/2585/pyu-rt-1-to-0-05-rohs-l-5-2585640.pdf?src-supplier=Digi-Key; LCSC Part Number: C705720
TP8-TP11 = TEST POINT 0.5mm Dia: Test Point ON; Item Type: Test Point; Manufacturer Part Number: TEST POINT 0.5mm Dia
U15 = SY8089AAAC: Step-down type SOT-23-5 DC-DC Converters ROHS; Manufacturer: Silergy; Item Type: IC; Supplier 1: LCSC; Manufacturer Part Number: SY8089AAAC; RoHS: No; Supplier Part Number 1: C78988; LCSC Part Number: C78988; ComponentLink1Description: LCSC; ComponentLink1URL: https://www.lcsc.com/product-detail/DC-DC-Converters_Silergy-Corp-SY8089AAAC_C78988.html
U19 U20 = PAM2312AABADJ: IC REG BUCK ADJ 1A SYNC SOT25; Manufacturer: Diodes; Supplier: Digikey; LCSC Part Number: C157537; Manufacturer Part Number: PAM2312AABADJ; RoHS: Yes; Item Type: IC; Stock: 10405; Pricing: 1=0.52, 10=0.424, 25=0.388, 100=0.2886, 250=0.26156, 500=0.21646, 1000=0.16235 (USD); ComponentLink1URL: https://datasheet.ciiva.com/25651/pam2312-25651235.pdf?src-supplier=Digikey; ComponentLink1Description: https://datasheet.ciiva.com/25651/pam2312-25651235.pdf?src-supplier=Digikey; ComponentLink2URL: https://datasheet.ciiva.com/29731/pam2312-29731333.pdf?src-supplier=Digikey; ComponentLink2Description: https://datasheet.ciiva.com/29731/pam2312-29731333.pdf?src-supplier=Digikey; ComponentLink3URL: https://datasheet.ciiva.com/29731/pam2312-29731338.pdf?src-supplier=Digikey; ComponentLink3Description: https://datasheet.ciiva.com/29731/pam2312-29731338.pdf?src-supplier=Digikey; ComponentLink4URL: https://datasheet.ciiva.com/30032/pam2312-30032043.pdf?src-supplier=Avnet; ComponentLink4Description: https://datasheet.ciiva.com/30032/pam2312-30032043.pdf?src-supplier=Avnet